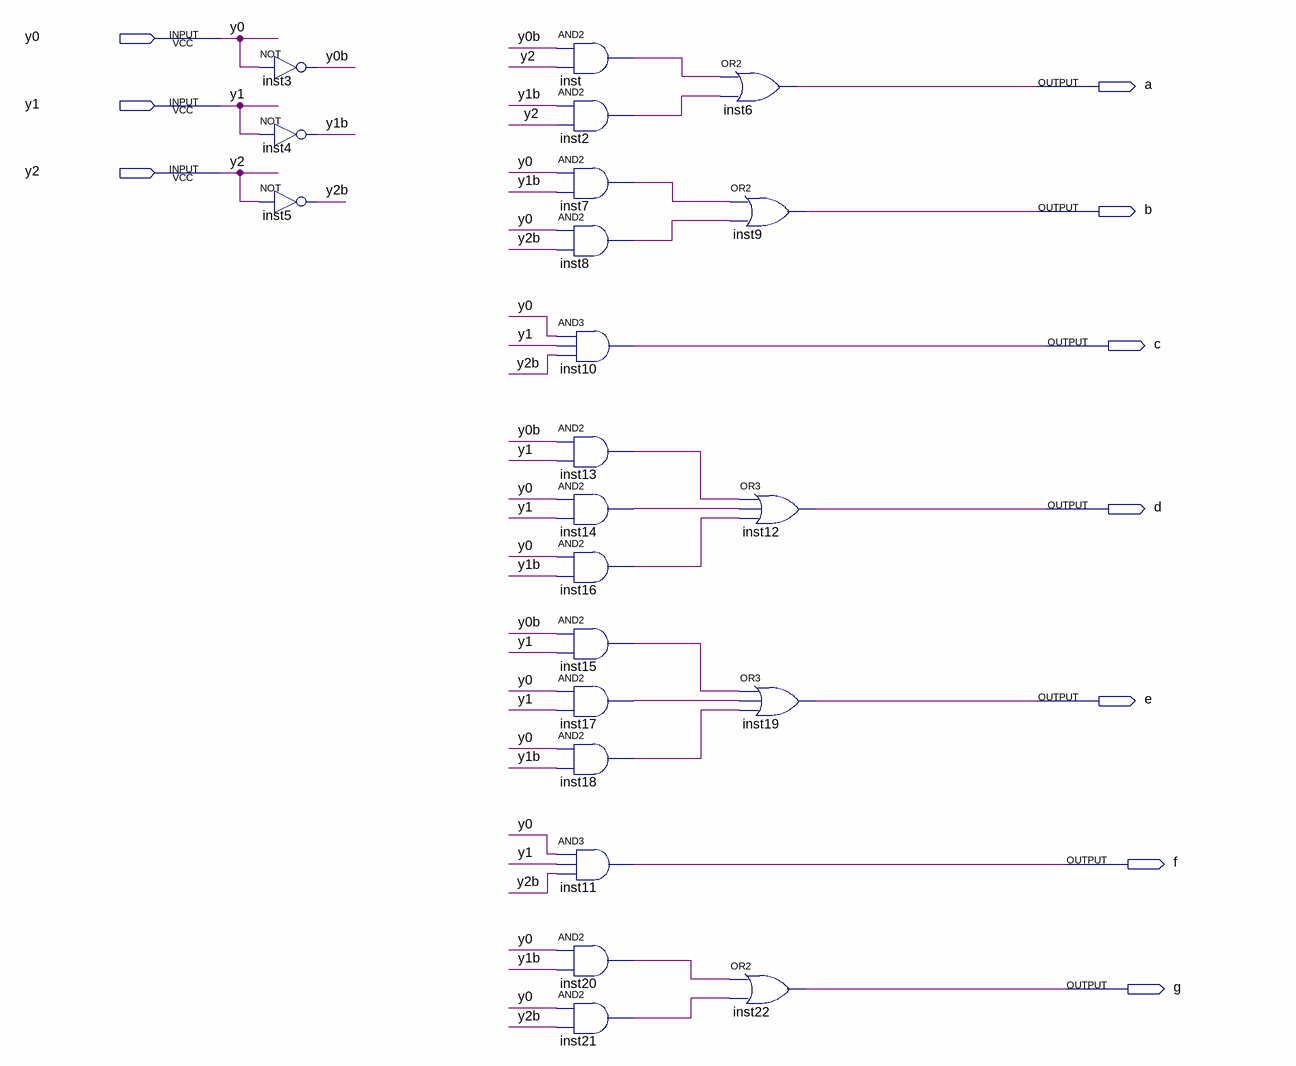
[diagram p0: schematic sheet]
// Quartus schematic FPGA_3bit_3x7_Decoder.bdf as structural Verilog: 22 symbols, 10 pins
module FPGA_3bit_3x7_Decoder (
  input  y0,
  input  y1,
  input  y2,
  output a,
  output b,
  output c,
  output d,
  output e,
  output f,
  output g
);

  wire inst2_out, inst7_out, inst8_out, inst13_out, inst14_out, inst15_out, inst16_out, inst17_out,
       inst18_out, inst20_out, inst21_out, inst_out, y0b, y1b, y2b;

  not inst3 (y0b, y0);
  not inst4 (y1b, y1);
  not inst5 (y2b, y2);
  and inst (inst_out, y0b, y2);
  and inst2 (inst2_out, y1b, y2);
  and inst7 (inst7_out, y0, y1b);
  and inst8 (inst8_out, y0, y2b);
  and inst10 (c, y0, y1, y2b);
  and inst13 (inst13_out, y0b, y1);
  and inst14 (inst14_out, y0, y1);
  and inst16 (inst16_out, y0, y1b);
  and inst15 (inst15_out, y0b, y1);
  and inst17 (inst17_out, y0, y1);
  and inst18 (inst18_out, y0, y1b);
  and inst11 (f, y0, y1, y2b);
  and inst20 (inst20_out, y0, y1b);
  and inst21 (inst21_out, y0, y2b);
  or inst6 (a, inst_out, inst2_out);
  or inst9 (b, inst7_out, inst8_out);
  or inst22 (g, inst20_out, inst21_out);
  or inst12 (d, inst13_out, inst14_out, inst16_out);
  or inst19 (e, inst15_out, inst17_out, inst18_out);
endmodule
